# Altium schematic sheet 02.C102. A41-A73. Module DC power.SchDoc: Силовой кабель
size 209 x 297 mm; Author: Мурашкин Д.В.; Address1: Address1; Address2: Address2; Address3: Address3; Address4: Address4; DocumentNumber: ИЗДЕЛИЕ-1-2; SheetNumber: 4; Scale: 1:1; Letter1Column: Э
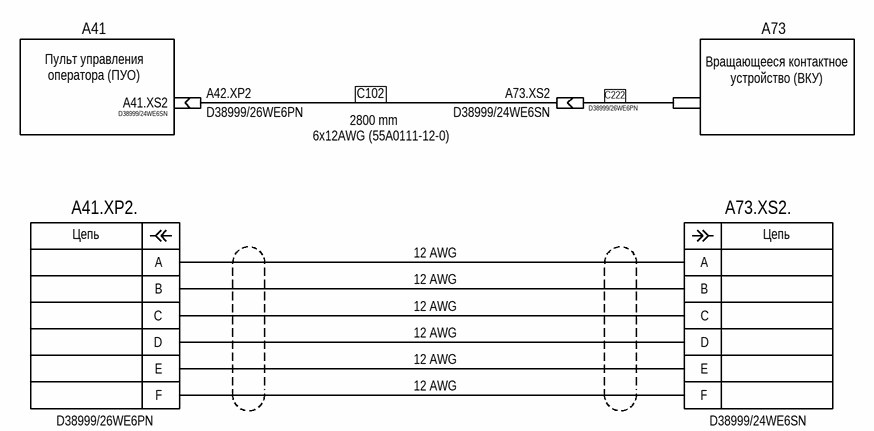
[diagram p0: 02.C102. A41-A73. Module DC power.SchDoc]

## Parts
A41.XP2.  D38999/26WE6PN
A41.XS2  D38999/24WE6SN
A42.XP2  D38999/26WE6PN
A73.XP2  D38999/26WE6PN
A73.XS2  D38999/24WE6SN
A73.XS2.  D38999/24WE6SN
A?  Провод  (value not drawn)  (no BOM)

## Nets
С102: A42.XP2.0 A73.XS2.0
С222: A73.XP2.0 A?.0
NetA41.XP2._A: A41.XP2..A A73.XS2..A
NetA41.XP2._B: A41.XP2..B A73.XS2..B
NetA41.XP2._C: A41.XP2..C A73.XS2..C
NetA41.XP2._D: A41.XP2..D A73.XS2..D
NetA41.XP2._E: A41.XP2..E A73.XS2..E
NetA41.XP2._F: A41.XP2..F A73.XS2..F

Not connected (* = marked no-connect by the designer): A41.XS2 0

## Notes on the sheet
- A41
- A73
- (near A41.XS2) Пульт управления оператора (ПУО)
- (near A?) Вращающееся контактное устройство (ВКУ)
- 6x12AWG (55A0111-12-0)
- 2800 mm
- 12 AWG
- Перв. примен.
- Справ. №
- Подп. и дата
- Инв. № дубл.
- Взам. инв. №
- Инв. № подл.
- Изм.
- Лист
- № докум.
- Подп.
- Дата
- 2.106-A4
- Копировал
- Формат А4
- (in symbol Connector signal P6) Цепь

## Library data of the parts
A41.XP2. A73.XS2. = Connector signal P6: P6 MIL; Operating temperature: -°C +°C; Mounting type: Surface mount; Dimension: .0mm x .0mm; Height: .0mm
  A41.XP2.: Part name: D38999/26WE6PN
  A73.XS2.: Part name: D38999/24WE6SN
A41.XS2 A73.XS2 = Connector cable socket: Part name: D38999/24WE6SN; Operating temperature: -°C +°C; Mounting type: Surface mount; Dimension: .0mm x .0mm; Height: .0mm
A42.XP2 A73.XP2 = Connector cable plug: Part name: D38999/26WE6PN; Operating temperature: -°C +°C; Mounting type: Surface mount; Dimension: .0mm x .0mm; Height: .0mm
A? = Connector cable coupling: Operating temperature: -°C +°C; Mounting type: Surface mount; Dimension: .0mm x .0mm; Height: .0mm